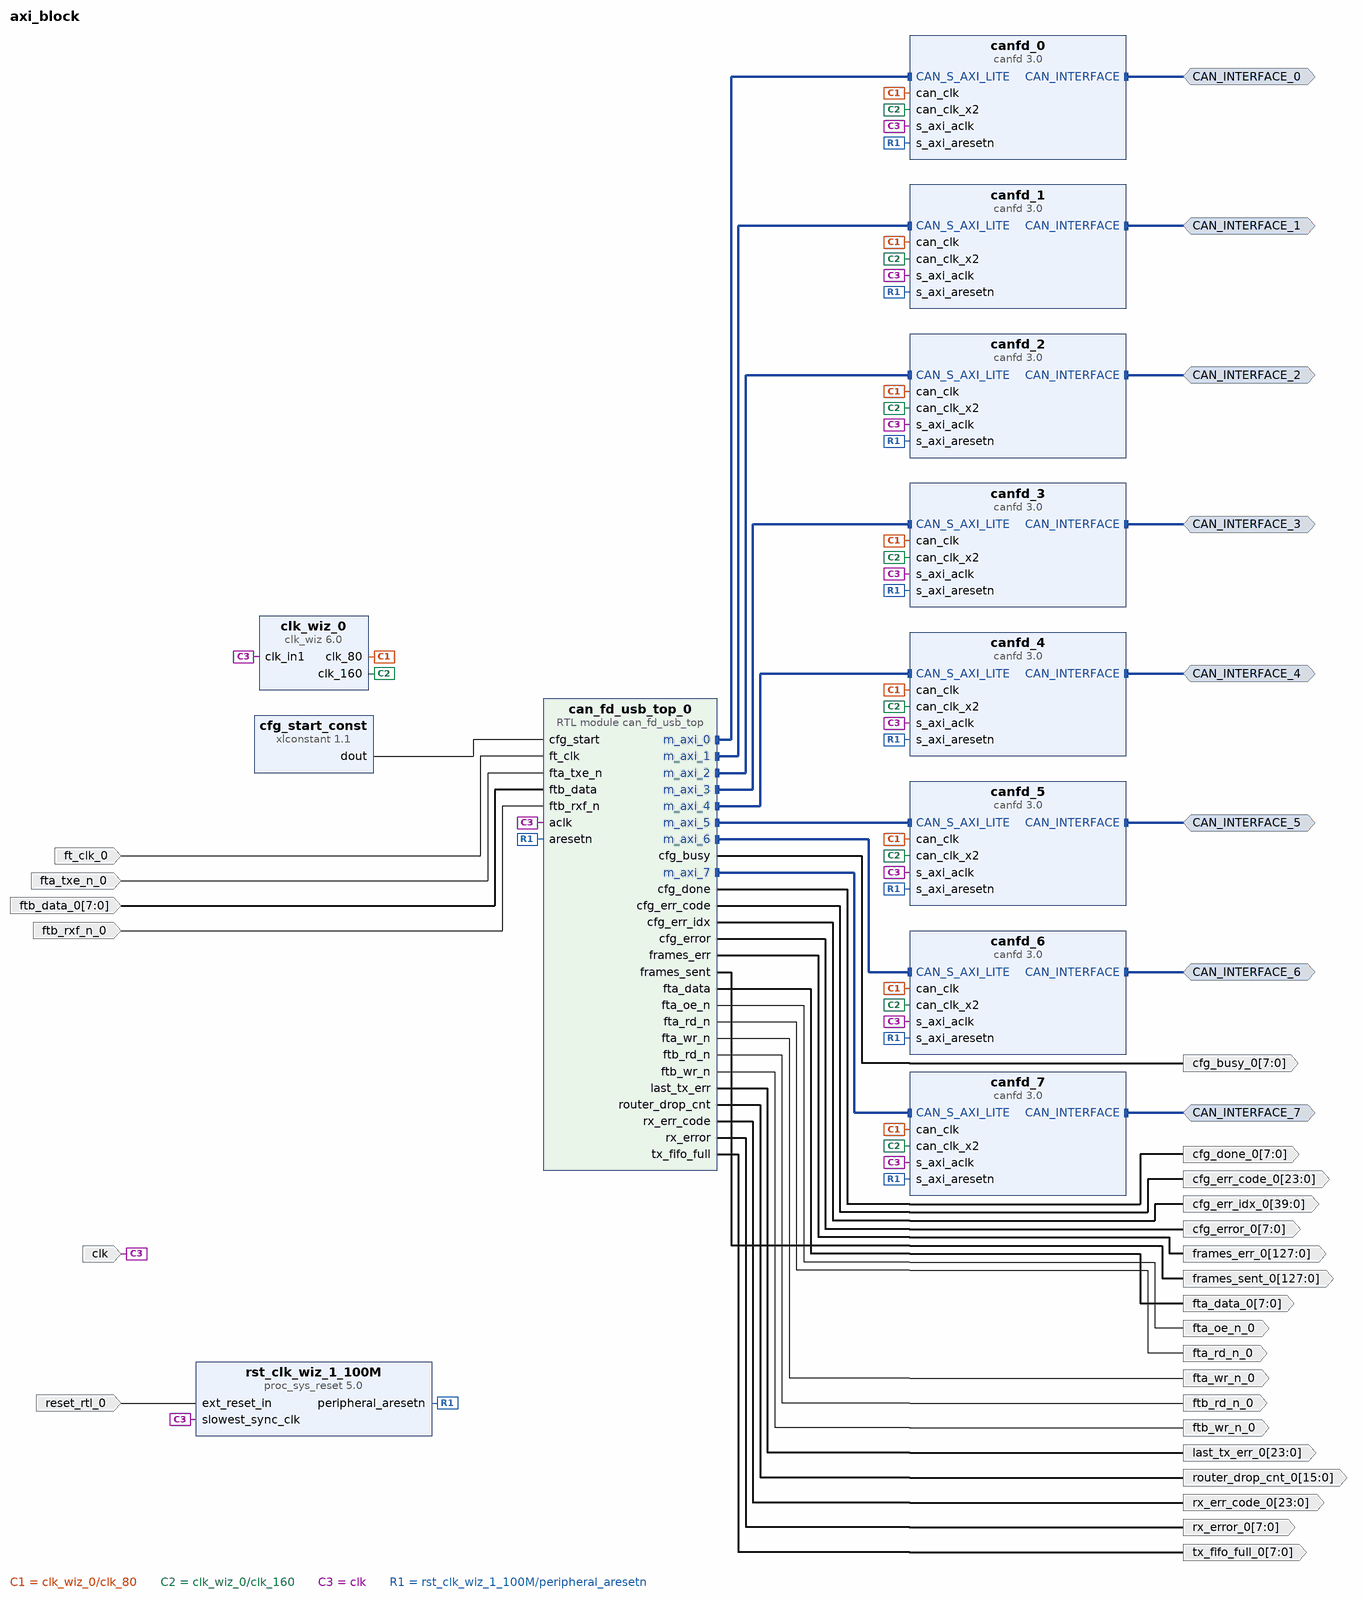
[diagram p0: block diagram of the top level]
# Vivado block design axi_block, xc7s6ftgb196-1, Vivado 2025.2
create_bd_design axi_block

create_bd_intf_port -mode Master -vlnv xilinx.com:interface:can_rtl:1.0 CAN_INTERFACE_0
create_bd_intf_port -mode Master -vlnv xilinx.com:interface:can_rtl:1.0 CAN_INTERFACE_1
create_bd_intf_port -mode Master -vlnv xilinx.com:interface:can_rtl:1.0 CAN_INTERFACE_2
create_bd_intf_port -mode Master -vlnv xilinx.com:interface:can_rtl:1.0 CAN_INTERFACE_3
create_bd_intf_port -mode Master -vlnv xilinx.com:interface:can_rtl:1.0 CAN_INTERFACE_4
create_bd_intf_port -mode Master -vlnv xilinx.com:interface:can_rtl:1.0 CAN_INTERFACE_5
create_bd_intf_port -mode Master -vlnv xilinx.com:interface:can_rtl:1.0 CAN_INTERFACE_6
create_bd_intf_port -mode Master -vlnv xilinx.com:interface:can_rtl:1.0 CAN_INTERFACE_7
create_bd_port -dir I -type rst reset_rtl_0
set_property -dict {CONFIG.POLARITY ACTIVE_LOW} [get_bd_ports reset_rtl_0]
create_bd_port -dir I -type clk clk
set_property -dict {CONFIG.FREQ_HZ 100000000} [get_bd_ports clk]
create_bd_port -dir O fta_oe_n_0
create_bd_port -dir O ftb_rd_n_0
create_bd_port -dir O ftb_wr_n_0
create_bd_port -dir O fta_rd_n_0
create_bd_port -dir O -from 7 -to 0 fta_data_0
create_bd_port -dir O fta_wr_n_0
create_bd_port -dir O -from 127 -to 0 frames_sent_0
create_bd_port -dir I -type clk ft_clk_0
create_bd_port -dir I fta_txe_n_0
create_bd_port -dir I -from 7 -to 0 ftb_data_0
create_bd_port -dir I ftb_rxf_n_0
create_bd_port -dir O -from 7 -to 0 rx_error_0
create_bd_port -dir O -from 23 -to 0 rx_err_code_0
create_bd_port -dir O -from 7 -to 0 tx_fifo_full_0
create_bd_port -dir O -from 15 -to 0 router_drop_cnt_0
create_bd_port -dir O -from 127 -to 0 frames_err_0
create_bd_port -dir O -from 23 -to 0 last_tx_err_0
create_bd_port -dir O -from 7 -to 0 cfg_error_0
create_bd_port -dir O -from 7 -to 0 cfg_done_0
create_bd_port -dir O -from 7 -to 0 cfg_busy_0
create_bd_port -dir O -from 23 -to 0 cfg_err_code_0
create_bd_port -dir O -from 39 -to 0 cfg_err_idx_0

create_bd_cell -type ip -vlnv xilinx.com:ip:proc_sys_reset:5.0 rst_clk_wiz_1_100M
create_bd_cell -type ip -vlnv xilinx.com:ip:canfd:3.0 canfd_0
set_property -dict [list \
  CONFIG.C_EN_APB 0 \
  CONFIG.C_RX_FIFO_0_DEPTH 64 \
  CONFIG.C_RX_FIFO_1_DEPTH 64 \
  CONFIG.NUM_OF_TX_BUF 32 \
] [get_bd_cells canfd_0]
create_bd_cell -type ip -vlnv xilinx.com:ip:clk_wiz:6.0 clk_wiz_0
set_property -dict [list \
  CONFIG.CLKOUT1_JITTER 260.522 \
  CONFIG.CLKOUT1_PHASE_ERROR 301.601 \
  CONFIG.CLKOUT1_REQUESTED_OUT_FREQ 80 \
  CONFIG.CLKOUT2_JITTER 235.916 \
  CONFIG.CLKOUT2_PHASE_ERROR 301.601 \
  CONFIG.CLKOUT2_REQUESTED_OUT_FREQ 160 \
  CONFIG.CLKOUT2_USED true \
  CONFIG.CLK_OUT1_PORT clk_80 \
  CONFIG.CLK_OUT2_PORT clk_160 \
  CONFIG.MMCM_CLKFBOUT_MULT_F 48.000 \
  CONFIG.MMCM_CLKOUT0_DIVIDE_F 12.000 \
  CONFIG.MMCM_CLKOUT1_DIVIDE 6 \
  CONFIG.MMCM_DIVCLK_DIVIDE 5 \
  CONFIG.NUM_OUT_CLKS 2 \
  CONFIG.USE_LOCKED false \
  CONFIG.USE_RESET false \
] [get_bd_cells clk_wiz_0]
create_bd_cell -type ip -vlnv xilinx.com:ip:xlconstant:1.1 cfg_start_const
set_property -dict {CONFIG.CONST_VAL 0 CONFIG.CONST_WIDTH 8} [get_bd_cells cfg_start_const]
create_bd_cell -type module -reference can_fd_usb_top can_fd_usb_top_0
set_property -dict {CONFIG.BASE0 0x44A00000} [get_bd_cells can_fd_usb_top_0]
create_bd_cell -type ip -vlnv xilinx.com:ip:canfd:3.0 canfd_1
set_property -dict [list \
  CONFIG.C_EN_APB 0 \
  CONFIG.C_RX_FIFO_0_DEPTH 64 \
  CONFIG.C_RX_FIFO_1_DEPTH 64 \
  CONFIG.NUM_OF_TX_BUF 32 \
] [get_bd_cells canfd_1]
create_bd_cell -type ip -vlnv xilinx.com:ip:canfd:3.0 canfd_2
set_property -dict [list \
  CONFIG.C_EN_APB 0 \
  CONFIG.C_RX_FIFO_0_DEPTH 64 \
  CONFIG.C_RX_FIFO_1_DEPTH 64 \
  CONFIG.NUM_OF_TX_BUF 32 \
] [get_bd_cells canfd_2]
create_bd_cell -type ip -vlnv xilinx.com:ip:canfd:3.0 canfd_3
set_property -dict [list \
  CONFIG.C_EN_APB 0 \
  CONFIG.C_RX_FIFO_0_DEPTH 64 \
  CONFIG.C_RX_FIFO_1_DEPTH 64 \
  CONFIG.NUM_OF_TX_BUF 32 \
] [get_bd_cells canfd_3]
create_bd_cell -type ip -vlnv xilinx.com:ip:canfd:3.0 canfd_4
set_property -dict [list \
  CONFIG.C_EN_APB 0 \
  CONFIG.C_RX_FIFO_0_DEPTH 64 \
  CONFIG.C_RX_FIFO_1_DEPTH 64 \
  CONFIG.NUM_OF_TX_BUF 32 \
] [get_bd_cells canfd_4]
create_bd_cell -type ip -vlnv xilinx.com:ip:canfd:3.0 canfd_5
set_property -dict [list \
  CONFIG.C_EN_APB 0 \
  CONFIG.C_RX_FIFO_0_DEPTH 64 \
  CONFIG.C_RX_FIFO_1_DEPTH 64 \
  CONFIG.NUM_OF_TX_BUF 32 \
] [get_bd_cells canfd_5]
create_bd_cell -type ip -vlnv xilinx.com:ip:canfd:3.0 canfd_6
set_property -dict [list \
  CONFIG.C_EN_APB 0 \
  CONFIG.C_RX_FIFO_0_DEPTH 64 \
  CONFIG.C_RX_FIFO_1_DEPTH 64 \
  CONFIG.NUM_OF_TX_BUF 32 \
] [get_bd_cells canfd_6]
create_bd_cell -type ip -vlnv xilinx.com:ip:canfd:3.0 canfd_7
set_property -dict [list \
  CONFIG.C_EN_APB 0 \
  CONFIG.C_RX_FIFO_0_DEPTH 64 \
  CONFIG.C_RX_FIFO_1_DEPTH 64 \
  CONFIG.NUM_OF_TX_BUF 32 \
] [get_bd_cells canfd_7]

# ---- connections ----

connect_bd_intf_net [get_bd_intf_pins can_fd_usb_top_0/m_axi_0] [get_bd_intf_pins canfd_0/CAN_S_AXI_LITE]
connect_bd_intf_net [get_bd_intf_pins can_fd_usb_top_0/m_axi_1] [get_bd_intf_pins canfd_1/CAN_S_AXI_LITE]
connect_bd_intf_net [get_bd_intf_pins can_fd_usb_top_0/m_axi_2] [get_bd_intf_pins canfd_2/CAN_S_AXI_LITE]
connect_bd_intf_net [get_bd_intf_pins can_fd_usb_top_0/m_axi_3] [get_bd_intf_pins canfd_3/CAN_S_AXI_LITE]
connect_bd_intf_net [get_bd_intf_pins can_fd_usb_top_0/m_axi_4] [get_bd_intf_pins canfd_4/CAN_S_AXI_LITE]
connect_bd_intf_net [get_bd_intf_pins can_fd_usb_top_0/m_axi_5] [get_bd_intf_pins canfd_5/CAN_S_AXI_LITE]
connect_bd_intf_net [get_bd_intf_pins can_fd_usb_top_0/m_axi_6] [get_bd_intf_pins canfd_6/CAN_S_AXI_LITE]
connect_bd_intf_net [get_bd_intf_pins can_fd_usb_top_0/m_axi_7] [get_bd_intf_pins canfd_7/CAN_S_AXI_LITE]
connect_bd_intf_net [get_bd_intf_ports CAN_INTERFACE_0] [get_bd_intf_pins canfd_0/CAN_INTERFACE]
connect_bd_intf_net [get_bd_intf_ports CAN_INTERFACE_1] [get_bd_intf_pins canfd_1/CAN_INTERFACE]
connect_bd_intf_net [get_bd_intf_ports CAN_INTERFACE_2] [get_bd_intf_pins canfd_2/CAN_INTERFACE]
connect_bd_intf_net [get_bd_intf_ports CAN_INTERFACE_3] [get_bd_intf_pins canfd_3/CAN_INTERFACE]
connect_bd_intf_net [get_bd_intf_ports CAN_INTERFACE_4] [get_bd_intf_pins canfd_4/CAN_INTERFACE]
connect_bd_intf_net [get_bd_intf_ports CAN_INTERFACE_5] [get_bd_intf_pins canfd_5/CAN_INTERFACE]
connect_bd_intf_net [get_bd_intf_ports CAN_INTERFACE_6] [get_bd_intf_pins canfd_6/CAN_INTERFACE]
connect_bd_intf_net [get_bd_intf_ports CAN_INTERFACE_7] [get_bd_intf_pins canfd_7/CAN_INTERFACE]
connect_bd_net [get_bd_pins can_fd_usb_top_0/cfg_busy] [get_bd_ports cfg_busy_0]
connect_bd_net [get_bd_pins can_fd_usb_top_0/cfg_done] [get_bd_ports cfg_done_0]
connect_bd_net [get_bd_pins can_fd_usb_top_0/cfg_err_code] [get_bd_ports cfg_err_code_0]
connect_bd_net [get_bd_pins can_fd_usb_top_0/cfg_err_idx] [get_bd_ports cfg_err_idx_0]
connect_bd_net [get_bd_pins can_fd_usb_top_0/cfg_error] [get_bd_ports cfg_error_0]
connect_bd_net [get_bd_pins can_fd_usb_top_0/frames_err] [get_bd_ports frames_err_0]
connect_bd_net [get_bd_pins can_fd_usb_top_0/frames_sent] [get_bd_ports frames_sent_0]
connect_bd_net [get_bd_pins can_fd_usb_top_0/fta_data] [get_bd_ports fta_data_0]
connect_bd_net [get_bd_pins can_fd_usb_top_0/fta_oe_n] [get_bd_ports fta_oe_n_0]
connect_bd_net [get_bd_pins can_fd_usb_top_0/fta_rd_n] [get_bd_ports fta_rd_n_0]
connect_bd_net [get_bd_pins can_fd_usb_top_0/fta_wr_n] [get_bd_ports fta_wr_n_0]
connect_bd_net [get_bd_pins can_fd_usb_top_0/ftb_rd_n] [get_bd_ports ftb_rd_n_0]
connect_bd_net [get_bd_pins can_fd_usb_top_0/ftb_wr_n] [get_bd_ports ftb_wr_n_0]
connect_bd_net [get_bd_pins can_fd_usb_top_0/last_tx_err] [get_bd_ports last_tx_err_0]
connect_bd_net [get_bd_pins can_fd_usb_top_0/router_drop_cnt] [get_bd_ports router_drop_cnt_0]
connect_bd_net [get_bd_pins can_fd_usb_top_0/rx_err_code] [get_bd_ports rx_err_code_0]
connect_bd_net [get_bd_pins can_fd_usb_top_0/rx_error] [get_bd_ports rx_error_0]
connect_bd_net [get_bd_pins can_fd_usb_top_0/tx_fifo_full] [get_bd_ports tx_fifo_full_0]
connect_bd_net [get_bd_pins cfg_start_const/dout] [get_bd_pins can_fd_usb_top_0/cfg_start]
connect_bd_net [get_bd_pins clk_wiz_0/clk_80] \
  [get_bd_pins canfd_0/can_clk] [get_bd_pins canfd_1/can_clk] [get_bd_pins canfd_2/can_clk] [get_bd_pins canfd_3/can_clk] \
  [get_bd_pins canfd_4/can_clk] [get_bd_pins canfd_5/can_clk] [get_bd_pins canfd_6/can_clk] [get_bd_pins canfd_7/can_clk]
connect_bd_net [get_bd_pins clk_wiz_0/clk_160] \
  [get_bd_pins canfd_0/can_clk_x2] [get_bd_pins canfd_1/can_clk_x2] [get_bd_pins canfd_2/can_clk_x2] \
  [get_bd_pins canfd_3/can_clk_x2] [get_bd_pins canfd_4/can_clk_x2] [get_bd_pins canfd_5/can_clk_x2] \
  [get_bd_pins canfd_6/can_clk_x2] [get_bd_pins canfd_7/can_clk_x2]
connect_bd_net -net ft_clk_0_1 [get_bd_ports ft_clk_0] [get_bd_pins can_fd_usb_top_0/ft_clk]
connect_bd_net -net fta_txe_n_0_1 [get_bd_ports fta_txe_n_0] [get_bd_pins can_fd_usb_top_0/fta_txe_n]
connect_bd_net -net ftb_data_0_1 [get_bd_ports ftb_data_0] [get_bd_pins can_fd_usb_top_0/ftb_data]
connect_bd_net -net ftb_rxf_n_0_1 [get_bd_ports ftb_rxf_n_0] [get_bd_pins can_fd_usb_top_0/ftb_rxf_n]
connect_bd_net -net microblaze_0_Clk [get_bd_ports clk] \
  [get_bd_pins rst_clk_wiz_1_100M/slowest_sync_clk] [get_bd_pins canfd_0/s_axi_aclk] [get_bd_pins clk_wiz_0/clk_in1] \
  [get_bd_pins canfd_1/s_axi_aclk] [get_bd_pins canfd_2/s_axi_aclk] [get_bd_pins canfd_3/s_axi_aclk] \
  [get_bd_pins canfd_4/s_axi_aclk] [get_bd_pins canfd_5/s_axi_aclk] [get_bd_pins canfd_6/s_axi_aclk] \
  [get_bd_pins canfd_7/s_axi_aclk] [get_bd_pins can_fd_usb_top_0/aclk]
connect_bd_net -net reset_rtl_0_1 [get_bd_ports reset_rtl_0] [get_bd_pins rst_clk_wiz_1_100M/ext_reset_in]
connect_bd_net [get_bd_pins rst_clk_wiz_1_100M/peripheral_aresetn] \
  [get_bd_pins canfd_0/s_axi_aresetn] [get_bd_pins canfd_1/s_axi_aresetn] [get_bd_pins canfd_2/s_axi_aresetn] \
  [get_bd_pins canfd_3/s_axi_aresetn] [get_bd_pins canfd_4/s_axi_aresetn] [get_bd_pins canfd_7/s_axi_aresetn] \
  [get_bd_pins canfd_5/s_axi_aresetn] [get_bd_pins canfd_6/s_axi_aresetn] [get_bd_pins can_fd_usb_top_0/aresetn]

# ---- address map ----
assign_bd_address -offset 0x44A00000 -range 64K -target_address_space [get_bd_addr_spaces can_fd_usb_top_0/m_axi_0] [get_bd_addr_segs canfd_0/S_AXI_LITE/Reg]
assign_bd_address -offset 0x44A10000 -range 64K -target_address_space [get_bd_addr_spaces can_fd_usb_top_0/m_axi_1] [get_bd_addr_segs canfd_1/S_AXI_LITE/Reg]
assign_bd_address -offset 0x44A20000 -range 64K -target_address_space [get_bd_addr_spaces can_fd_usb_top_0/m_axi_2] [get_bd_addr_segs canfd_2/S_AXI_LITE/Reg]
assign_bd_address -offset 0x44A30000 -range 64K -target_address_space [get_bd_addr_spaces can_fd_usb_top_0/m_axi_3] [get_bd_addr_segs canfd_3/S_AXI_LITE/Reg]
assign_bd_address -offset 0x44A40000 -range 64K -target_address_space [get_bd_addr_spaces can_fd_usb_top_0/m_axi_4] [get_bd_addr_segs canfd_4/S_AXI_LITE/Reg]
assign_bd_address -offset 0x44A50000 -range 64K -target_address_space [get_bd_addr_spaces can_fd_usb_top_0/m_axi_5] [get_bd_addr_segs canfd_5/S_AXI_LITE/Reg]
assign_bd_address -offset 0x44A60000 -range 64K -target_address_space [get_bd_addr_spaces can_fd_usb_top_0/m_axi_6] [get_bd_addr_segs canfd_6/S_AXI_LITE/Reg]
assign_bd_address -offset 0x44A70000 -range 64K -target_address_space [get_bd_addr_spaces can_fd_usb_top_0/m_axi_7] [get_bd_addr_segs canfd_7/S_AXI_LITE/Reg]

validate_bd_design
save_bd_design
